# EAGLE design LEDCube-3x3x3 (EAGLE 9.6.2)
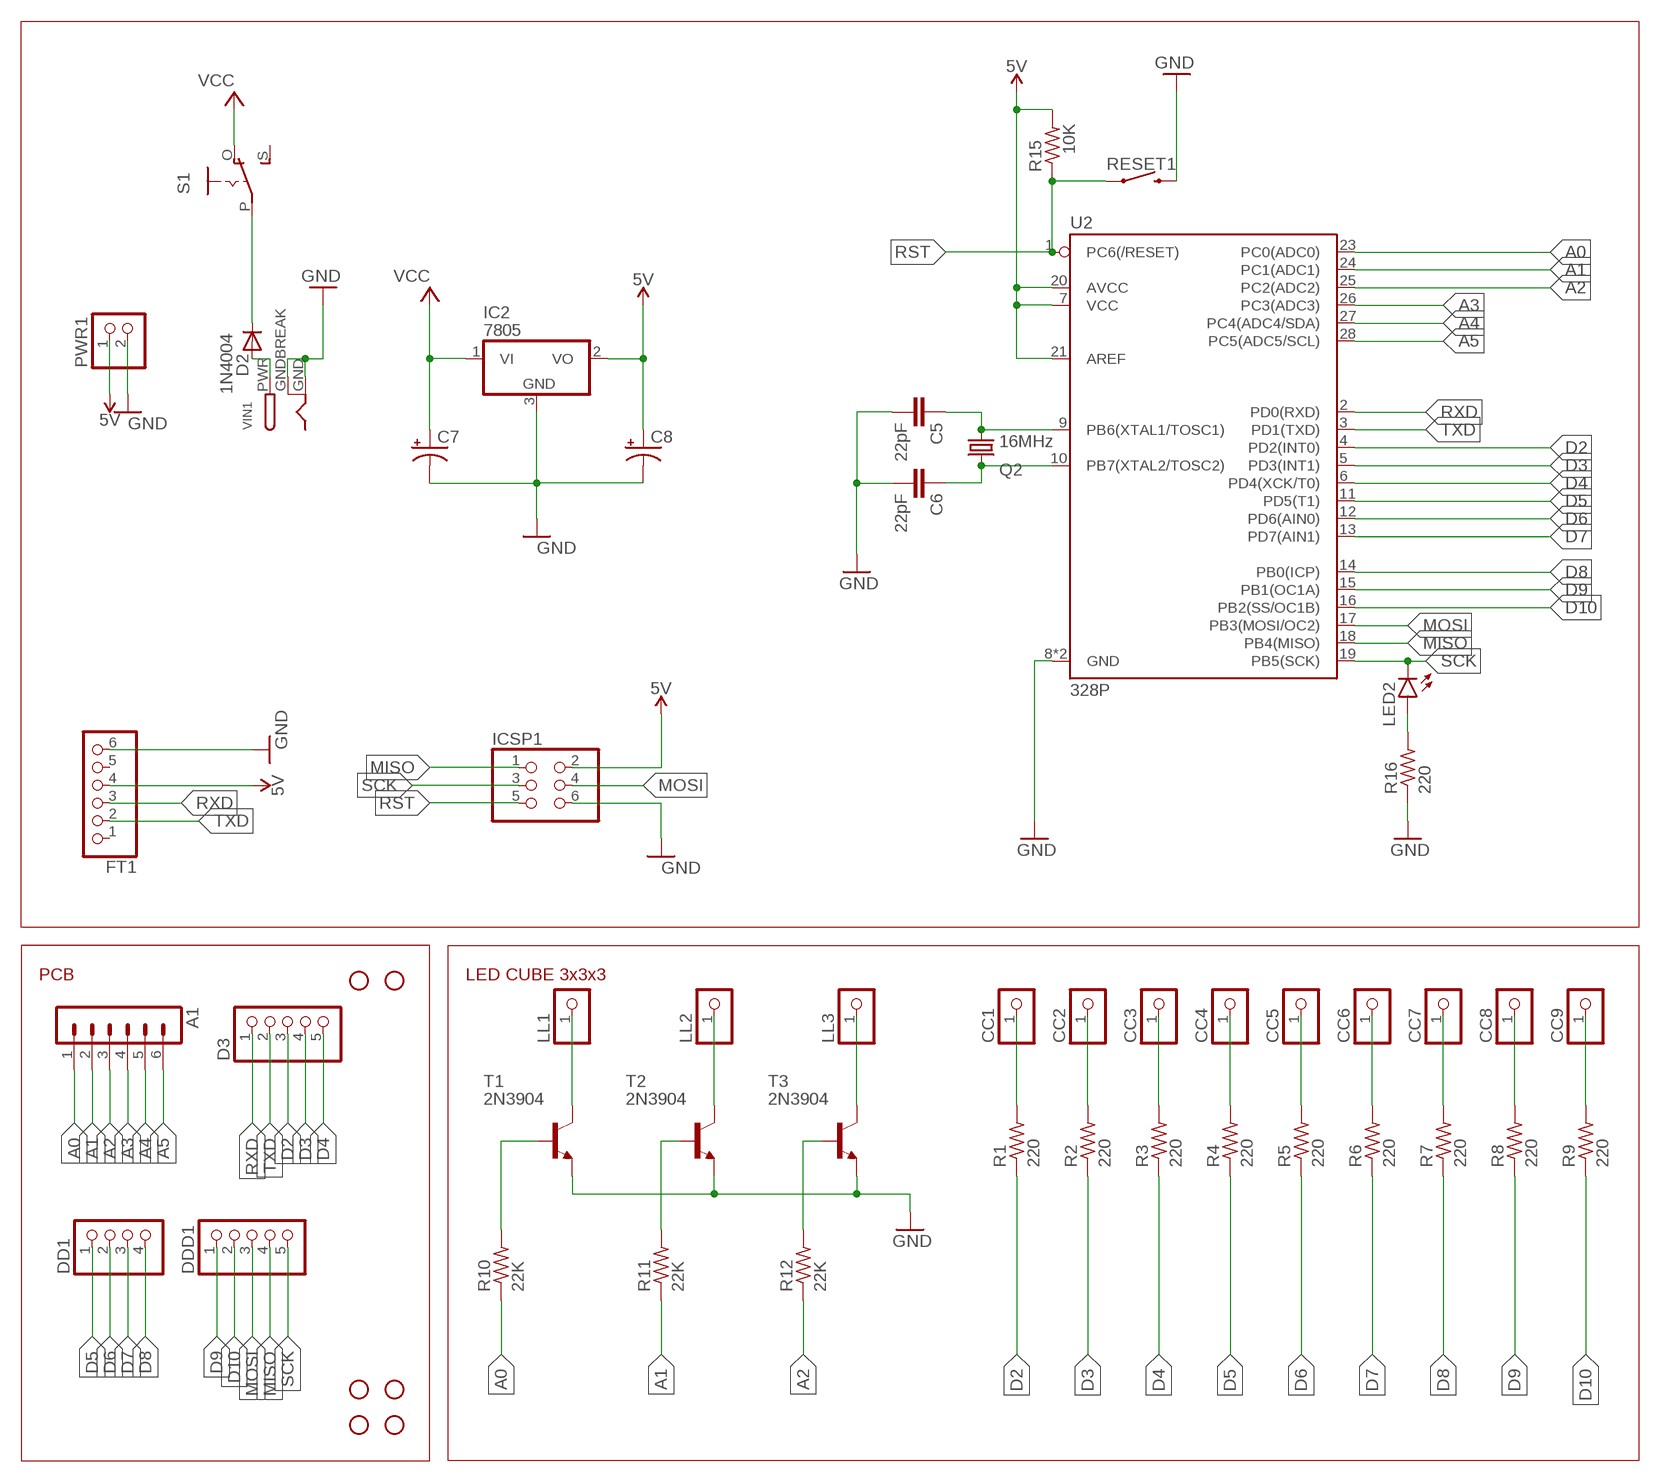
[diagram p0: schematic, sheet 1]

## Parts
A1  MA06-1  [MA06-1]
C5  22pF  22PF-PTH-2.54MM-200V-5%  [CAP-PTH-2.54]
C6  22pF  22PF-PTH-2.54MM-200V-5%  [CAP-PTH-2.54]
C7  CPOL-USE1.8-4  [E1,8-4]
C8  CPOL-USE1.8-4  [E1,8-4]
CC1  PINHD-1X1  [1X01]
CC2  PINHD-1X1  [1X01]
CC3  PINHD-1X1  [1X01]
CC4  PINHD-1X1  [1X01]
CC5  PINHD-1X1  [1X01]
CC6  PINHD-1X1  [1X01]
CC7  PINHD-1X1  [1X01]
CC8  PINHD-1X1  [1X01]
CC9  PINHD-1X1  [1X01]
D2  1N4004  [DO41-10]
D3  PINHD-1X5  [1X05]
DD1  PINHD-1X4  [1X04]
DDD1  PINHD-1X5  [1X05]
FT1  PINHD-1X6  [1X06]
H1  STAND-OFFTIGHT  [STAND-OFF-TIGHT]
H2  STAND-OFFTIGHT  [STAND-OFF-TIGHT]
H3  STAND-OFFTIGHT  [STAND-OFF-TIGHT]
H4  STAND-OFFTIGHT  [STAND-OFF-TIGHT]
H7  STAND-OFFTIGHT  [STAND-OFF-TIGHT]
H8  STAND-OFFTIGHT  [STAND-OFF-TIGHT]
IC2  7805  7806DT  [TO252]
ICSP1  PINHD-2X3  [2X03]
LED2  LEDCHIP-LED0805  [CHIP-LED0805]
LL1  PINHD-1X1  [1X01]
LL2  PINHD-1X1  [1X01]
LL3  PINHD-1X1  [1X01]
PWR1  PINHD-1X2  [1X02]
Q2  16MHz  CRYSTALHC49S  [HC49/S]
R1  220  R-US_R0805  [R0805]
R2  220  R-US_R0805  [R0805]
R3  220  R-US_R0805  [R0805]
R4  220  R-US_R0805  [R0805]
R5  220  R-US_R0805  [R0805]
R6  220  R-US_R0805  [R0805]
R7  220  R-US_R0805  [R0805]
R8  220  R-US_R0805  [R0805]
R9  220  R-US_R0805  [R0805]
R10  22K  R-US_R0805  [R0805]
R11  22K  R-US_R0805  [R0805]
R12  22K  R-US_R0805  [R0805]
R15  10K  R-US_R0805  [R0805]
R16  220  R-US_R0805  [R0805]
RESET1  MOMENTARY-SWITCH-SPST-PTH-6.0MM  [TACTILE_SWITCH_PTH_6.0MM]
S1  EG1218S  [EG1218]
T1  2N3904  [TO92]
T2  2N3904  [TO92]
T3  2N3904  [TO92]
U2  328P  ATMEGA328P_PDIP  [DIP28]
VIN1  DCBARRELPTH  [DCJACK_2MM_PTH]

## Nets
5V: C8.+ FT1.4 IC2.2(VO) ICSP1.2 PWR1.1 R15.2 U2.7(VCC) U2.20(AVCC) U2.21(AREF)
A0: A1.1 R10.1 U2.23(PC0(ADC0))
A1: A1.2 R11.1 U2.24(PC1(ADC1))
A2: A1.3 R12.1 U2.25(PC2(ADC2))
A3: A1.4 U2.26(PC3(ADC3))
A4: A1.5 U2.27(PC4(ADC4/SDA))
A5: A1.6 U2.28(PC5(ADC5/SCL))
C3: CC3.1 R3.2
D2: D3.3 R1.1 U2.4(PD2(INT0))
D3: D3.4 R2.1 U2.5(PD3(INT1))
D4: D3.5 R3.1 U2.6(PD4(XCK/T0))
D5: DD1.1 R4.1 U2.11(PD5(T1))
D6: DD1.2 R5.1 U2.12(PD6(AIN0))
D7: DD1.3 R6.1 U2.13(PD7(AIN1))
D8: DD1.4 R7.1 U2.14(PB0(ICP))
D9: DDD1.1 R8.1 U2.15(PB1(OC1A))
D10: DDD1.2 R9.1 U2.16(PB2(SS/OC1B))
GND: C5.2 C6.2 C7.- C8.- FT1.6 IC2.3(GND) ICSP1.6 PWR1.2 R16.1 RESET1.3 T1.3(E) T2.3(E) T3.3(E) U2.8(GND) U2.22(GND) VIN1.GND VIN1.GNDBREAK
MISO: DDD1.4 ICSP1.1 U2.18(PB4(MISO))
MOSI: DDD1.3 ICSP1.4 U2.17(PB3(MOSI/OC2))
N$1: R10.2 T1.2(B)
N$2: R11.2 T2.2(B)
N$3: R12.2 T3.2(B)
N$4: LL1.1 T1.1(C)
N$5: D2.C S1.P
N$9: LL2.1 T2.1(C)
N$10: LL3.1 T3.1(C)
N$14: CC1.1 R1.2
N$15: CC2.1 R2.2
N$17: CC4.1 R4.2
N$18: CC5.1 R5.2
N$19: CC6.1 R6.2
N$20: CC7.1 R7.2
N$21: CC8.1 R8.2
N$22: CC9.1 R9.2
N$32: C5.1 Q2.1 U2.9(PB6(XTAL1/TOSC1))
N$33: C6.1 Q2.2 U2.10(PB7(XTAL2/TOSC2))
N$34: LED2.A R16.2
N$35: D2.A VIN1.PWR
RST: ICSP1.5 R15.1 RESET1.1 U2.1(PC6(/RESET))
RXD: D3.1 FT1.3 U2.2(PD0(RXD))
SCK: DDD1.5 ICSP1.3 LED2.C U2.19(PB5(SCK))
TXD: D3.2 FT1.2 U2.3(PD1(TXD))
VCC: C7.+ IC2.1(VI) S1.O
Unconnected: FT1.1 FT1.5 S1.S

## Notes on the sheet
- PCB | LED CUBE 3x3x3

## Library data of the parts
A1 = con-lstb:MA06-1: PIN HEADER; OC_FARNELL: unknown; OC_NEWARK: unknown
C5 C6 = SparkFun-Capacitors:22PF: 22pF ceramic capacitors A capacitor is a passive two-terminal electrical component used to store electrical energy temporarily in an electric field.; PROD_ID: CAP-09128
C7 C8 = adafruit:CPOL-US: POLARIZED CAPACITOR, American symbol
CC1-CC9 LL1-LL3 = pinhead:PINHD-1X1: PIN HEADER
D2 = adafruit:1N4004: DIODE General purpose 1N400x type rectifier (With bigger pads) http://www.ladyada.net/library/pcb/eaglelibrary.html
D3 DDD1 = pinhead:PINHD-1X5: PIN HEADER
DD1 = pinhead:PINHD-1X4: PIN HEADER
FT1 = pinhead:PINHD-1X6: PIN HEADER
H1-H4 H7 H8 = SparkFun-Hardware:STAND-OFF: Stand Off Drill holes for mechanically mounting via screws, standoffs, etc. Note: Use the keepout ring to avoid running the screw head into surrounding components. Variant Overviews STAND-OFF - Mechanical footprint for a #4 phillips button head screw. STAND-OFF-TIGHT - Mechanical footprint for a #4 phillips button head screw, Example SparkFun Products Screw - Phillips Head (1/4", 4-40, 10 pack) <https://www.sparkfun.com/products/10453> (PRT-10453) Screw - Phillips Head (1/2", 4-40, 10 pack) <https://www.sparkfun.com/products/10452> (PRT-10452) Screw - Phillips Head (3/4", 4-40, 10 pack) <https://www.sparkfun.com/products/10451> (PRT-10451) Screw - Phillips Head (1", 4-40, 10 pack) <https://www.sparkfun.com/products/10450> (PRT-10450)
IC2 = linear:78*: Positive VOLTAGE REGULATOR Source: http://cache.national.com/ds/LM/LM78L05.pdf http://www.fairchildsemi.com/ds/LM/LM7805.pdf
ICSP1 = pinhead:PINHD-2X3: PIN HEADER
LED2 = led:LED: LED OSRAM: - CHIPLED LG R971, LG N971, LY N971, LG Q971, LY Q971, LO R971, LY R971 LH N974, LH R974 LS Q976, LO Q976, LY Q976 LO Q996 - Hyper CHIPLED LW Q18S LB Q993, LB Q99A, LB R99A - SideLED LS A670, LO A670, LY A670, LG A670, LP A670 LB A673, LV A673, LT A673, LW A673 LH A674 LY A675 LS A676, LA A676, LO A676, LY A676, LW A676 LS A679, LY A679, LG A679 - Hyper Micro SIDELED® LS Y876, LA Y876, LO Y876, LY Y876 LT Y87S - SmartLED LW L88C, LW L88S LB L89C, LB L89S, LG L890 LS L89K, LO L89K, LY L89K LS L896, LA L896, LO L896, LY L896 - TOPLED LS T670, LO T670, LY T670, LG T670, LP T670 LSG T670, LSP T670, LSY T670, LOP T670, LYG T670 LG T671, LOG T671, LSG T671 LB T673, LV T673, LT T673, LW T673 LH T674 LS T676, LA T676, LO T676, LY T676, LB T676, LH T676, LSB T676, LW T676 LB T67C, LV T67C, LT T67C, LS T67K, LO T67K, LY T67K, LW E67C LS E67B, LA E67B, LO E67B, LY E67B, LB E67C, LV E67C, LT E67C LW T67C LS T679, LY T679, LG T679 LS T770, LO T770, LY T770, LG T770, LP T770 LB T773, LV T773, LT T773, LW T773 LH T774 LS E675, LA E675, LY E675, LS T675 LS T776, LA T776, LO T776, LY T776, LB T776 LHGB T686 LT T68C, LB T68C - Hyper Mini TOPLED® LB M676 - Mini TOPLED Santana® LG M470 LS M47K, LO M47K, LY M47K Source: http://www.osram.convergy.de LUXEON: - LUMILED® LXK2-PW12-R00, LXK2-PW12-S00, LXK2-PW14-U00, LXK2-PW14-V00 LXK2-PM12-R00, LXK2-PM12-S00, LXK2-PM14-U00 LXK2-PE12-Q00, LXK2-PE12-R00, LXK2-PE12-S00, LXK2-PE14-T00, LXK2-PE14-U00 LXK2-PB12-K00, LXK2-PB12-L00, LXK2-PB12-M00, LXK2-PB14-N00, LXK2-PB14-P00, LXK2-PB14-Q00 LXK2-PR12-L00, LXK2-PR12-M00, LXK2-PR14-Q00, LXK2-PR14-R00 LXK2-PD12-Q00, LXK2-PD12-R00, LXK2-PD12-S00 LXK2-PH12-R00, LXK2-PH12-S00 LXK2-PL12-P00, LXK2-PL12-Q00, LXK2-PL12-R00 Source: www.luxeon.com KINGBRIGHT: KA-3528ASYC Source: www.kingbright.com
PWR1 = pinhead:PINHD-1X2: PIN HEADER
Q2 = crystal:CRYSTAL: CRYSTAL; OC_FARNELL: 1667008; OC_NEWARK: unknown
R1-R12 R15 R16 = adafruit:R-US_: RESISTOR, American symbol
RESET1 = SparkFun-Switches:MOMENTARY-SWITCH-SPST: Momentary Switch (Pushbutton) - SPST Normally-open (NO) SPST momentary switches (buttons, pushbuttons). Variants PTH-12MM - 12mm square, through-hole Momentary Pushbutton Switch - 12mm Square <https://www.sparkfun.com/products/9190> (COM-09190) PTH-6.0MM, PTH-6.0MM-KIT - 6.0mm square, through-hole Mini Pushbutton Switch <https://www.sparkfun.com/products/97> (COM-00097) KIT package intended for soldering kit's - only one side of pads' copper is exposed. PTH-RIGHT-ANGLE-KIT - Right-angle, through-hole Right Angle Tactile Button <https://www.sparkfun.com/products/10791> - Used on SparkFun BigTime Watch Kit <https://www.sparkfun.com/products/11734> SMD-12MM - 12mm square, surface-mount Tactile Button - SMD (12mm) <https://www.sparkfun.com/products/12993> (COM-12993) Used on SparkFun PicoBoard <https://www.sparkfun.com/products/11888> SMD-4.5MM - 4.5mm Square Trackball Switch Used on SparkFun Blackberry Trackballer Breakout <https://www.sparkfun.com/products/13169> SMD-4.6MMX2.8MM - 4.60mm x 2.80mm, surface mount Used on SparkFun SAMD21 Mini Breakout <https://www.sparkfun.com/products/13664> SMD-5.2MM, SMD-5.2-REDUNDANT - 5.2mm square, surface-mount Mini Pushbutton Switch - SMD <https://www.sparkfun.com/products/8720> (COM-08720) Used on Arduino Pro Mini <https://www.sparkfun.com/products/11114> REDUNDANT package connects both switch circuits together SMD-6.0X3.5MM - 6.0 x 3.5mm, surface mount Momentary Reset Switch SMD <https://www.sparkfun.com/products/8229> (COM-08229) SMD-6.2MM-TALL - 6.2mm square, surface mount Tactile Button - SMD (6mm) <https://www.sparkfun.com/products/12992> Used on SparkFun Digital Sandbox <https://www.sparkfun.com/products/12651> SMD-RIGHT-ANGLE - Right-angle, surface mount Used on SparkFun Block for Intel® Edison - Arduino <https://www.sparkfun.com/products/13036>; PROD_ID: SWCH-08441; SF_SKU: COM-00097
S1 = adafruit:EG1218: SLIDING SWITCH 0.1" spacing through hole, vertical SPDT slide switch http://www.ladyada.net/library/pcb/eaglelibrary.html
T1-T3 = transistor:2N3904: NPN TRANSISTOR
U2 = SparkFun-IC-Microcontroller:ATMEGA328P_PDIP: Atmel 328P Through hole ATMEGA328P uC used in the Arduino 32kb flash, 1k EEPROM, 2k SRAM Datasheet <http://www.sparkfun.com/datasheets/Components/SMD/ATMega328.pdf> SparkFun Products Storefront component: AVR 28 Pin 20MHz 32K 6A/D - ATMega328P <https://www.sparkfun.com/products/9061> (COM-09061) SparkFun Simon Says - Through-Hole Soldering Kit <https://www.sparkfun.com/products/10547> (KIT-10547) SparkFun Learn to Solder - Simon Says <https://www.sparkfun.com/products/13708> (KIT-13708) SparkFun BigTime Watch Kit <https://www.sparkfun.com/products/11734> (KIT-11734) SparkFun ClockIt <https://www.sparkfun.com/products/10930> (KIT-10930) SparkFun Serial Enabled LCD Kit <https://www.sparkfun.com/products/10097> (LCD-10097) SparkFun Simon Tilts - Through Hole Soldering Kit <https://www.sparkfun.com/products/12634> (KIT-12634) SparkFun Frequency Counter Kit <https://www.sparkfun.com/products/10140> (KIT-10140) FabFM Radio Kit <https://www.sparkfun.com/products/11043> (KIT-11043) SparkFun Binary Blaster Kit <https://www.sparkfun.com/products/12037> (KIT-12037) SparkFun Metro-Gnome <https://www.sparkfun.com/products/9236> (KIT-09236) ATmega328 with Arduino Optiboot (Uno) <https://www.sparkfun.com/products/10524> (DEV-10524); PROD_ID: IC-09136
VIN1 = adafruit:DCBARREL: 2.0mm DC Barrel Jack DCJACK_2MM_PTH - Through Hole Jack (4UConnector: 05537)

## Board
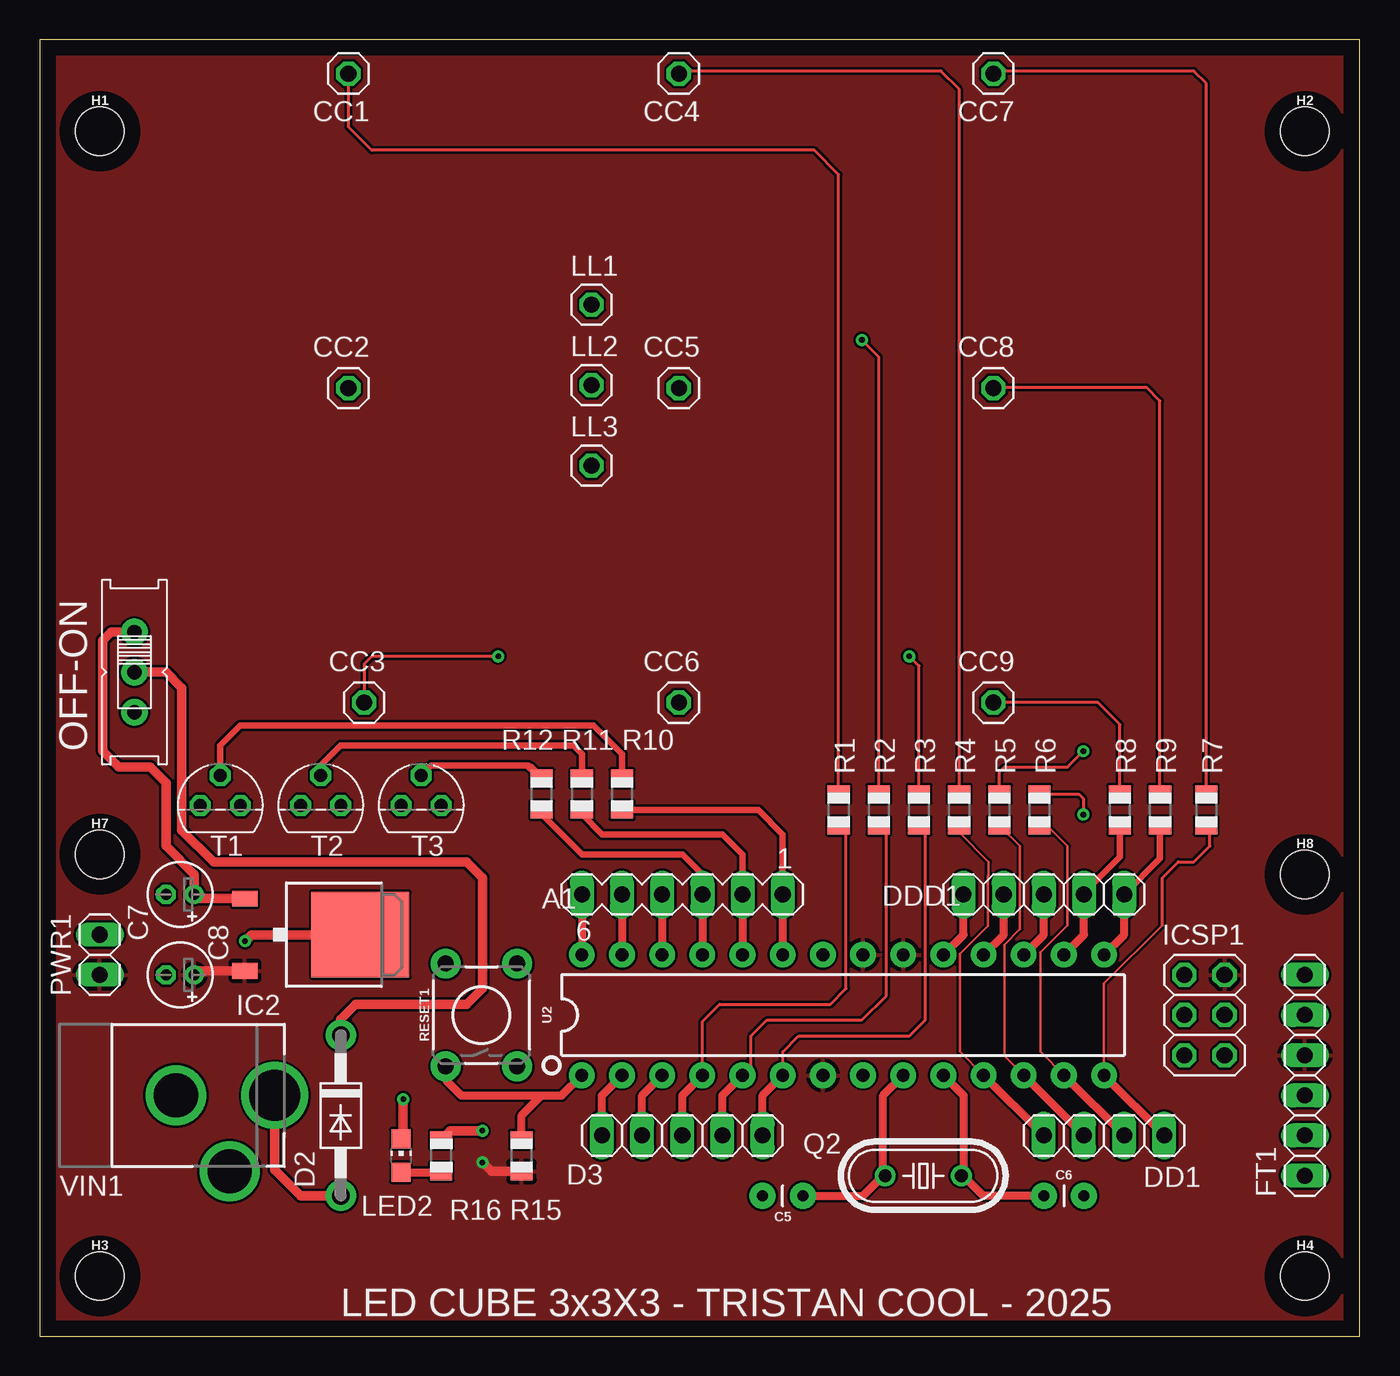
[diagram p1: board, top side]
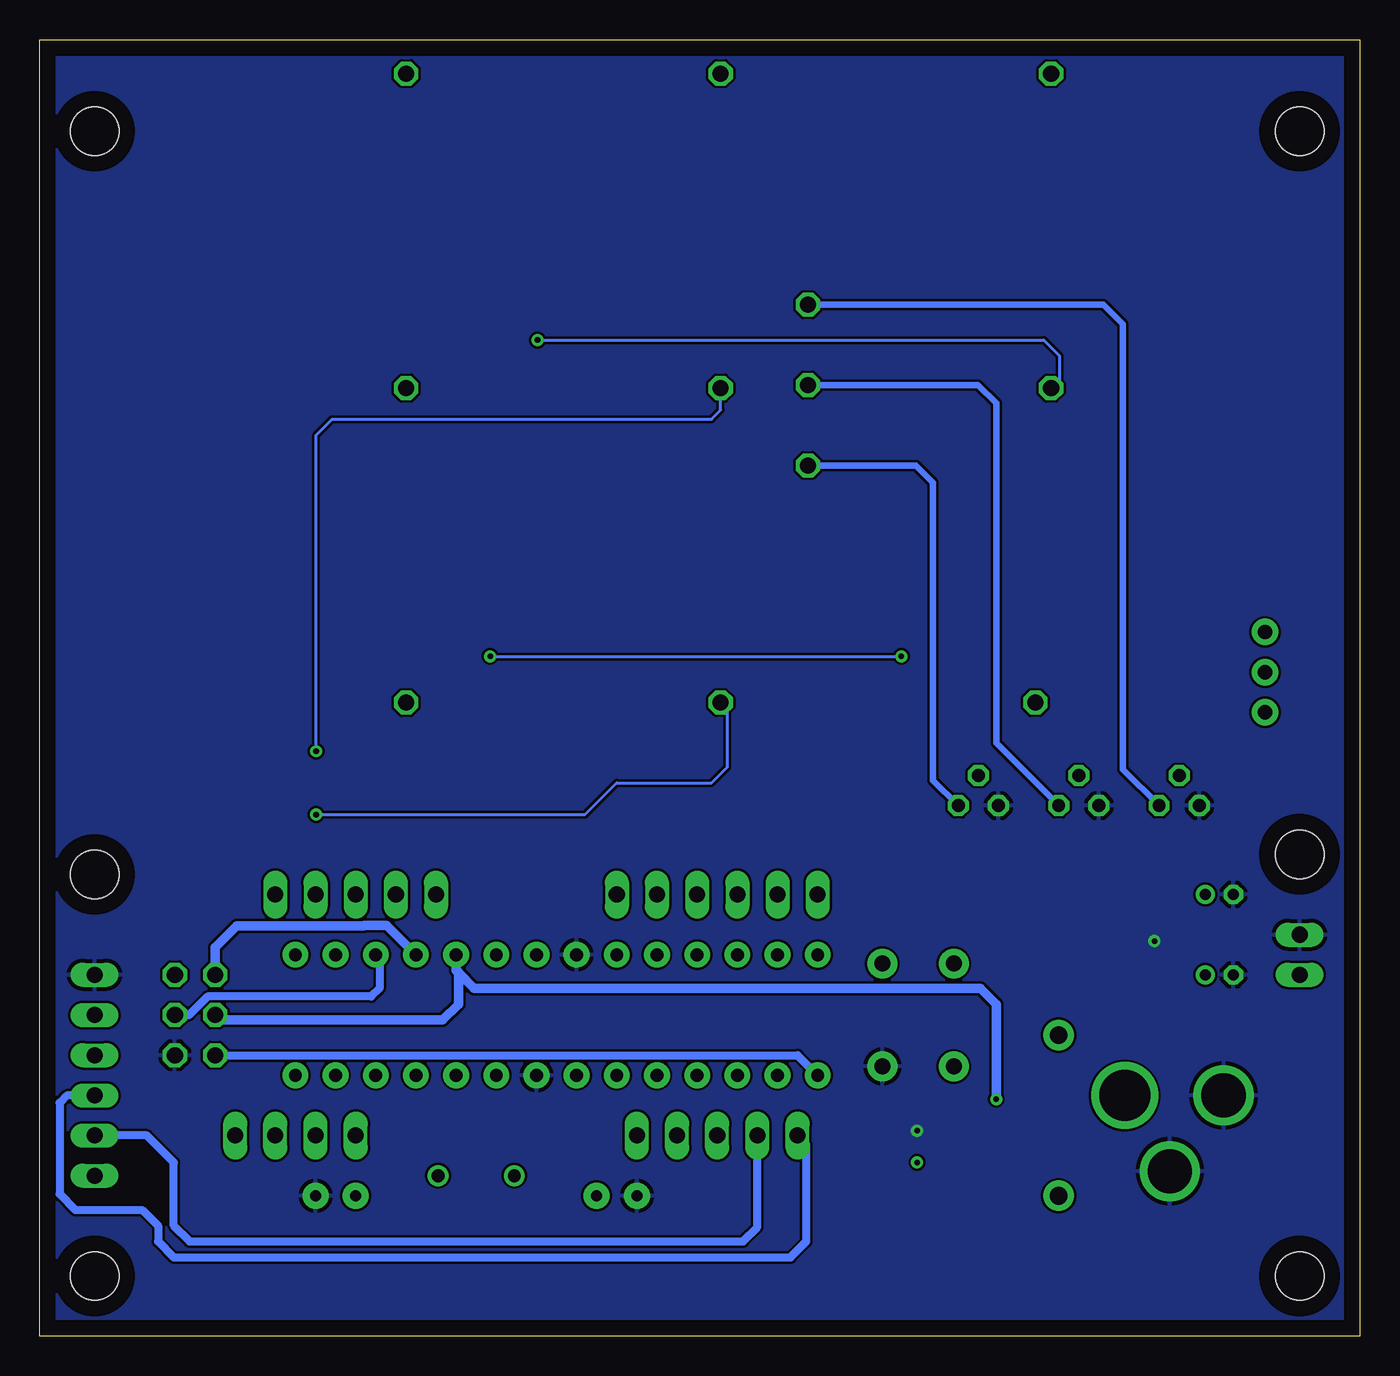
[diagram p2: board, bottom side, seen from below]

Size 83.49 x 82 mm. Coordinates in mm from the lower left corner, seen from the top.
Outline: 0,0 83.49,0 83.49,82 0,82 0,0
Copper layers (1*16): Top 0.035mm / dielectric 1.5mm / Bottom 0.035mm
Design rules "default": minimum track width 6mil, minimum drill 0.35mm, track to track 6mil, track to pad 6mil, pad to pad 6mil, via to via 6mil, smd to smd 6mil, copper to edge 40mil, drill to drill 6mil, minimum pad ring 10mil, minimum via ring 8mil, stop-mask expansion 4mil, vias tented up to drill 0mil, thermal gap 10mil

### Footprints (pad centres in the part's own frame; a part is rotated, then mirrored left to right if it is on the bottom)
MA06-1 = drill 1.016 long: 1 -6.35,0; 2 -3.81,0; 3 -1.27,0; 4 1.27,0; 5 3.81,0; 6 6.35,0
CAP-PTH-2.54 = drill 0.7 pad 1.651: 1 -1.27,0; 2 1.27,0
E1,8-4 = drill 0.711 pad 1.168: + -0.889,0 | drill 0.711 pad 1.168 octagon: - 0.889,0
1X01 = drill 1.016 octagon: 1 0,0
DO41-10 = drill 1.118 pad 1.93: A 5.08,0; C -5.08,0
1X05 = drill 1.016 long: 1 -5.08,0; 2 -2.54,0; 3 0,0; 4 2.54,0; 5 5.08,0
1X04 = drill 1.016 long: 1 -3.81,0; 2 -1.27,0; 3 1.27,0; 4 3.81,0
1X06 = drill 1.016 long: 1 -6.35,0; 2 -3.81,0; 3 -1.27,0; 4 1.27,0; 5 3.81,0; 6 6.35,0
STAND-OFF-TIGHT = hole 3.048: 0,0
TO252 = smd 1 x 1.6: 1 -2.28,-4.8; 2 2.28,-4.8 | smd 5.4 x 6.2: 3 0,2.5
2X03 = drill 1.016 octagon: 1 -2.54,-1.27; 2 -2.54,1.27; 3 0,-1.27; 4 0,1.27; 5 2.54,-1.27; 6 2.54,1.27
CHIP-LED0805 = smd 1.2 x 1.2: A 0,-1.05; C 0,1.05
1X02 = drill 1.016 long: 1 -1.27,0; 2 1.27,0
HC49/S = drill 0.813: 1 -2.413,0; 2 2.413,0
R0805 = smd 1.1 x 1.4: 1 -1,0; 2 1,0
TACTILE_SWITCH_PTH_6.0MM = drill 1.016 pad 1.88: 1 -3.251,2.261; 2 3.251,2.261; 3 -3.251,-2.261; 4 3.251,-2.261
EG1218 = drill 0.9 pad 1.676: O -2.54,0; P 0,0; S 2.54,0
TO92 = drill 0.813 octagon: 1 1.27,0; 2 0,1.905; 3 -1.27,0
DIP28 = drill 0.813 pad 1.626: 1 -16.51,-3.81; 2 -13.97,-3.81; 3 -11.43,-3.81; 4 -8.89,-3.81; 5 -6.35,-3.81; 6 -3.81,-3.81; 7 -1.27,-3.81; 8 1.27,-3.81; 9 3.81,-3.81; 10 6.35,-3.81; 11 8.89,-3.81; 12 11.43,-3.81; 13 13.97,-3.81; 14 16.51,-3.81; 15 16.51,3.81; 16 13.97,3.81; 17 11.43,3.81; 18 8.89,3.81; 19 6.35,3.81; 20 3.81,3.81; 21 1.27,3.81; 22 -1.27,3.81; 23 -3.81,3.81; 24 -6.35,3.81; 25 -8.89,3.81; 26 -11.43,3.81; 27 -13.97,3.81; 28 -16.51,3.81
DCJACK_2MM_PTH = drill 2.8: GND 0,7.35; GNDBREAK 4.8,10.75 | drill 3.2: PWR 0,13.6

### Placement (x,y rotation side)
A1  40.64,27.94 180 top
C5  46.99,8.89 180 top
C6  64.77,8.89 0 top
C7  8.89,27.94 180 top
C8  8.89,22.86 180 top
CC1  19.53,79.85 90 top
CC2  19.53,59.96 90 top
CC3  20.53,40.07 90 top
CC4  40.42,79.85 90 top
CC5  40.42,59.96 90 top
CC6  40.42,40.07 90 top
CC7  60.31,79.85 90 top
CC8  60.31,59.96 90 top
CC9  60.31,40.07 90 top
D2  19.05,13.97 270 top
D3  40.64,12.7 0 top
DD1  67.31,12.7 0 top
DDD1  63.5,27.94 180 top
FT1  80.01,16.51 90 top
H1  3.81,76.2 0 top
H2  80.01,76.2 0 top
H3  3.81,3.81 0 top
H4  80.01,3.81 0 top
H7  3.81,30.48 0 top
H8  80.01,29.21 0 top
IC2  17.78,25.4 270 top
ICSP1  73.66,20.32 270 top
LED2  22.86,11.43 0 top
LL1  34.91,65.23 0 top
LL2  34.91,60.15 0 top
LL3  34.91,55.07 0 top
PWR1  3.81,24.13 90 top
Q2  55.88,10.16 0 top
R1  50.53,33.29 90 top
R2  53.07,33.29 90 top
R3  55.61,33.29 90 top
R4  58.15,33.29 90 top
R5  60.69,33.29 90 top
R6  63.23,33.29 90 top
R7  73.77,33.29 90 top
R8  70.85,33.29 90 top
R9  68.31,33.29 90 top
R10  36.83,34.29 90 top
R11  34.29,34.29 90 top
R12  31.75,34.29 90 top
R15  30.48,11.43 270 top
R16  25.4,11.43 270 top
RESET1  27.94,20.32 90 top
S1  6,42 270 top
T1  11.43,33.56 0 top
T2  17.78,33.56 0 top
T3  24.13,33.56 0 top
U2  50.8,20.32 0 top
VIN1  1.27,15.24 270 top

### Tracks (layer width: path | path; a pad name or v marks a point on that pad's centre or on a via)
5V  (via drill 0.35)
  Top 0.61: C8.+ 10.04,23.12 IC2.2 | R15.2 28.57,10.43 v28,11
  pour Top: 0,0 0,82 84,82 84,0
A0
  Top 0.406: A1.1 46.99,31.75 45.45,33.29 R10.1
  Top 0.508: A1.1 U2.23
A1
  Top 0.406: A1.2 44.45,30.48 43.18,31.75 35.56,31.75 34.29,33.02 R11.1
  Top 0.508: A1.2 U2.24
A2
  Top 0.406: A1.3 41.91,29.21 40.64,30.48 34.29,30.48 31.75,33.02 R12.1
  Top 0.508: A1.3 U2.25
A3
  Top 0.508: A1.4 U2.26
A4
  Top 0.508: A1.5 U2.27
A5
  Top 0.508: A1.6 U2.28
C3  (via drill 0.35)
  Top 0.203: R3.2 55.61,42.39 v55,43 | v29,43 21,43 20.53,42.53 CC3.1
  Bottom 0.203: v55,43 v29,43
D2
  Top 0.2: U2.4 41.91,19.91 43,21 50,21 51,22 51,31.82 R1.1
  Top 0.508: D3.3 40.64,15.24 U2.4
D3
  Top 0.2: U2.5 45,17.06 45,19 46,20 52,20 53.55,21.55 53.55,31.82 R2.1
  Top 0.508: D3.4 43.18,15.24 U2.5
D4
  Top 0.2: U2.6 47,18 48,19 55,19 56,20 56,31.9 R3.1
  Top 0.508: D3.5 45.72,15.24 U2.6
D5
  Top 0.152: U2.11 58.19,18.01 58.19,24.19 59.97,25.97 59.97,29.11 60,29.14 60,30 58.15,31.85 R4.1
  Top 0.508: DD1.1 U2.11
D6
  Top 0.152: R5.1 61.98,31 62,31 62,25.76 61,24.76 61,17.74 U2.12
  Top 0.508: U2.12 DD1.2
D7
  Top 0.152: U2.13 63.27,18.01 63.27,24.27 65,26 65,31 63.71,32.29 R6.1
  Top 0.508: U2.13 DD1.3
D8
  Top 0.152: U2.14 67.31,22.31 71,26
  Top 0.203: R7.1 74,32.06 74,31 73,30 72,30 71,29 71,26
  Top 0.508: U2.14 DD1.4
D9
  Top 0.406: DDD1.1 70.85,30.21 R8.1
  Top 0.508: U2.15 68.58,25.4 DDD1.1
D10
  Top 0.406: DDD1.2 66.04,28.04 68.31,30.31 R9.1
  Top 0.508: U2.16 66.04,25.4 DDD1.2
GND  (via drill 0.35)
  Top 0.61: IC2.3 13.4,25.4 v13,25 | R16.1 25.97,13 v28,13
  pour Bottom: 0,0 0,82 84,82 84,80 84,0 82,0
MISO
  Top 0.508: U2.18 60.96,25.4 DDD1.4
  Bottom 0.61: U2.18 61.56,26 62.95,26 62.99,25.96 71.04,25.96 72.39,24.61 ICSP1.1
MOSI
  Top 0.508: U2.17 63.5,25.4 DDD1.3
  Bottom 0.508: ICSP1.4 74.04,20.32 72.87,21.49 62.51,21.49 62,22 62,23.9 U2.17
N$1
  Top 0.406: R10.2 36.83,36.83 35.02,38.64 12.7,38.64 11.43,37.37 T1.2
N$2
  Top 0.406: R11.2 34.29,36.83 33.75,37.37 19.05,37.37 17.78,36.1 T2.2
N$3
  Top 0.406: T3.2 24.77,36.1 30.9,36.1 31,36
  Top 0.508: R12.2 31.71,35.29 31,36
N$4
  Bottom 0.406: LL1.1 16.23,65.23 15,64 15,35.86 T1.1
N$5
  Top 0.61: D2.C 19.05,20.05 20,21 27,21 28,22 28,29 27,30 11,30 9,32 9,41 8,42 S1.P
N$9
  Bottom 0.406: LL2.1 24.15,60.15 23,59 23,37.51 T2.1
N$10
  Bottom 0.406: LL3.1 28.07,55.07 27,54 27,35.16 T3.1
N$14
  Top 0.203: R1.2 50.53,73.47 49,75 21,75 19.53,76.47 CC1.1
N$15  (via drill 0.35)
  Top 0.203: R2.2 53.07,61.93 v52,63
  Bottom 0.203: v52,63 20,63 19,62 19,60.49 CC2.1
N$17
  Top 0.203: R4.2 58.15,78.85 57,80 40.57,80 CC4.1
N$18  (via drill 0.35)
  Top 0.203: R5.2 60.69,35.69 61,36 65,36 v66,37
  Bottom 0.203: v66,37 66,57 65,58 41,58 40.42,58.58 CC5.1
N$19  (via drill 0.35)
  Top 0.203: R6.2 65.71,34.29 66,34 v66,33
  Bottom 0.203: v66,33 49,33 47,35 41,35 40,36 40,39.65 CC6.1
N$20
  Top 0.203: R7.2 73.77,79.23 73,80 60.46,80 CC7.1
N$21
  Top 0.203: R8.2 70.85,59.15 70,60 60.35,60 CC8.1
N$22
  Top 0.203: R9.2 68.31,38.69 66.93,40.07 CC9.1
N$32
  Top 0.508: Q2.1 53.4,10.22 | 53.4,10.22 53.34,10.29 53.34,15.24 U2.9 | C5.1 52.07,8.89 53.4,10.22
N$33
  Top 0.508: U2.10 58.42,15.24 58.42,10.29 58.36,10.22 | 58.36,10.22 Q2.2 | C6.1 59.69,8.89 58.36,10.22
N$34
  Top 0.508: LED2.A 25.35,10.38 R16.2
N$35
  Top 0.61: D2.A 16.51,8.89 14.87,10.53 VIN1.PWR
RST
  Top 0.508: RESET1.1 25.68,16.23 26.67,15.24 31.75,15.24 | U2.1 33.02,15.24 31.75,15.24 | R15.1 30.48,13.97 31.75,15.24
  Bottom 0.508: ICSP1.5 35.56,17.78 U2.1
RXD
  Top 0.508: D3.1 35.56,15.24 U2.2
  Bottom 0.508: FT1.3 81.76,15.24 82.22,14.78 82.22,9 81.22,8 77,8 76,7 76,6 75,5 36,5 35,6 35,12.14 D3.1
SCK  (via drill 0.35)
  Top 0.508: U2.19 58.42,25.4 DDD1.5
  Top 0.61: v23,15 23,12.62 LED2.C
  Bottom 0.61: U2.19 57.15,23.15 57,23 | v23,15 23,21 24,22 56,22 57,23 | ICSP1.3 72.07,20 58,20 57,21 57,23
TXD
  Top 0.508: D3.2 38.1,15.24 U2.3
  Bottom 0.508: D3.2 38.1,6.9 39,6 74,6 75,7 75,11 76.7,12.7 FT1.2
VCC
  Top 0.61: IC2.1 10.04,27.68 C7.+ 9.78,29.22 8,31 8,35 7,36 5,36 4,37 4,44 4.54,44.54 S1.O

### Text on the board
tNames: OFF-ON | LED CUBE 3x3X3 - TRISTAN COOL - 2025